# Altium schematic sheet LEDS.SchDoc
size A4 portrait; SheetNumber: 2; SheetTotal: 3
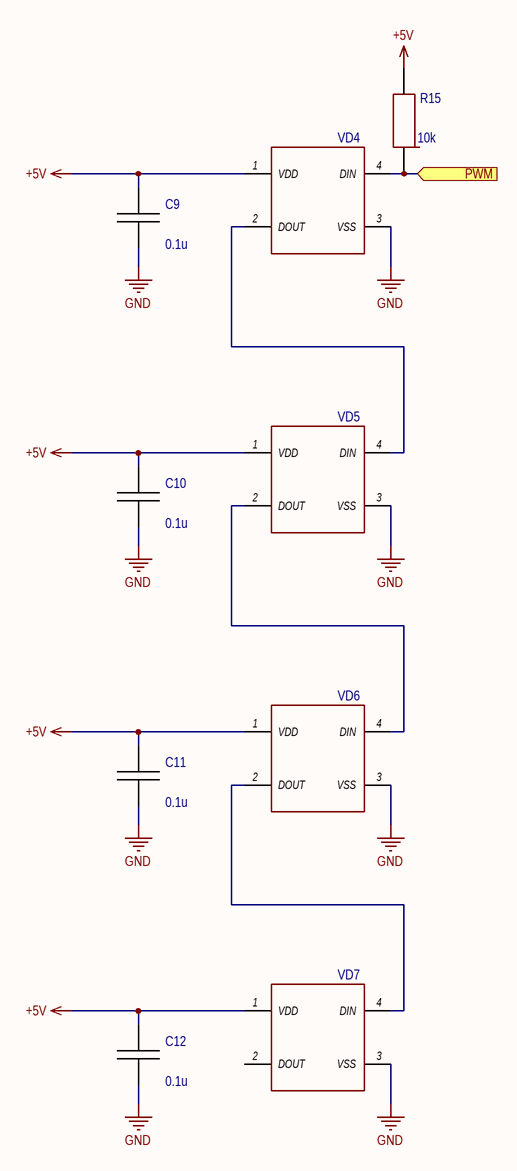
[diagram p0: LEDS.SchDoc]

## Parts
C9  0.1u  [C0402]
C10  0.1u  [C0402]
C11  0.1u  [C0402]
C12  0.1u  [C0402]
R15  10k  [0402]
VD4  ws2812b 5050  [LED 5050 ws2812b]  (value not drawn)
VD5  ws2812b 5050  [LED 5050 ws2812b]  (value not drawn)
VD6  ws2812b 5050  [LED 5050 ws2812b]  (value not drawn)
VD7  ws2812b 5050  [LED 5050 ws2812b]  (value not drawn)

## Ports
PWM (in, see Control block[4B])

## Nets
+5V: C9.2 C10.2 C11.2 C12.2 R15.2 VD4.1(VDD) VD5.1(VDD) VD6.1(VDD) VD7.1(VDD)
GND: C9.1 C10.1 C11.1 C12.1 VD4.3(VSS) VD5.3(VSS) VD6.3(VSS) VD7.3(VSS)
PWM: R15.1 VD4.4(DIN) ; port PWM
NetVD4_2: VD4.2(DOUT) VD5.4(DIN)
NetVD5_2: VD5.2(DOUT) VD6.4(DIN)
NetVD6_2: VD6.2(DOUT) VD7.4(DIN)

Not connected (* = marked no-connect by the designer): VD7 2(DOUT)

## Library data of the parts
C9-C12 = Capacitor
R15 = Resistor